# Altium schematic sheet AT-kdCONN.SchDoc
size A4; SheetNumber: 3; SheetTotal: 3
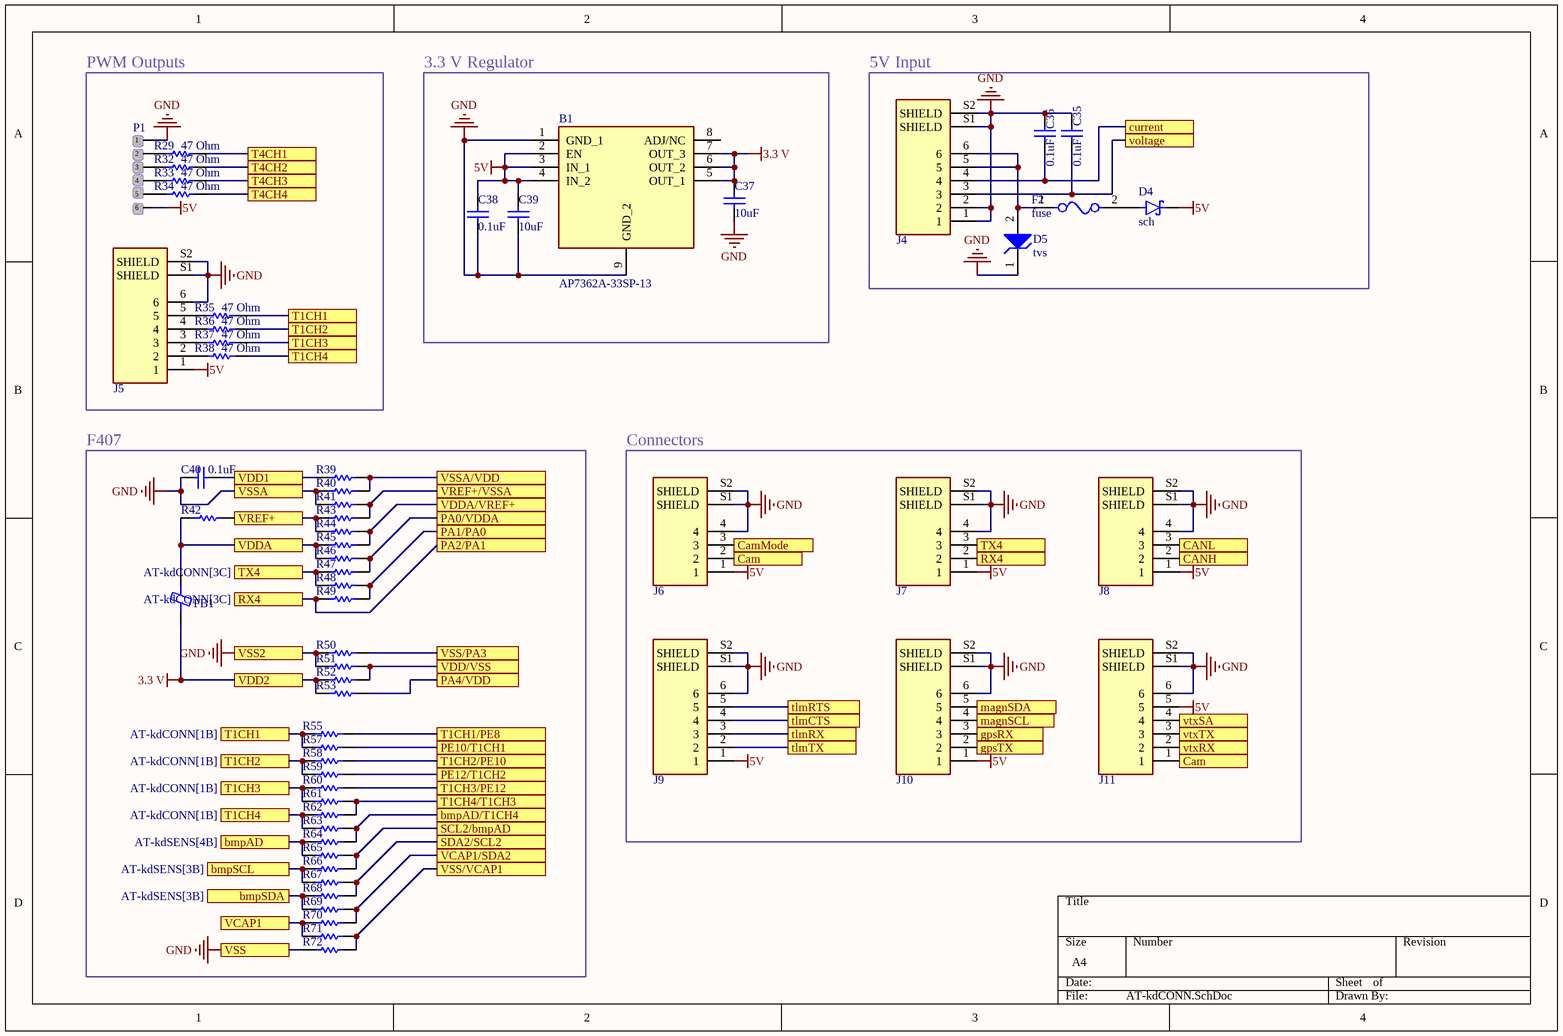
[diagram p0: AT-kdCONN.SchDoc]

## Parts
B1  AP7362A-33SP-13  [SOIC127P600X150-9N]
C35  0.1uF  [Capacitor-0603]
C36  0.1uF  [Capacitor-0603]
C37  10uF  [Capacitor-0603]
C38  0.1uF  [Capacitor-0603]
C39  10uF  [Capacitor-0603]
C40  0.1uF  [Capacitor-0603]
D4  sch  [SODFL3619X98N]
D5  tvs  [ONSC-SOD-123FL-2-498_V]
F2  fuse  [FP-MF-NSMF012-2-MFG]
FB1  100 Ohms @ 100 MHz  [BEADC1608X75N]  (value not drawn)
J4  BM06B-GHS-TBT(LF)(SN)(N)  [JST_BM06B-GHS-TBT(LF)(SN)(N)]  (value not drawn)
J5  BM06B-GHS-TBT(LF)(SN)(N)  [JST_BM06B-GHS-TBT(LF)(SN)(N)]  (value not drawn)
J6  BM04B-GHS-TBT(LF)(SN)(N)  [JST_BM04B-GHS-TBT(LF)(SN)(N)]  (value not drawn)
J7  BM04B-GHS-TBT(LF)(SN)(N)  [JST_BM04B-GHS-TBT(LF)(SN)(N)]  (value not drawn)
J8  BM04B-GHS-TBT(LF)(SN)(N)  [JST_BM04B-GHS-TBT(LF)(SN)(N)]  (value not drawn)
J9  BM06B-GHS-TBT(LF)(SN)(N)  [JST_BM06B-GHS-TBT(LF)(SN)(N)]  (value not drawn)
J10  BM06B-GHS-TBT(LF)(SN)(N)  [JST_BM06B-GHS-TBT(LF)(SN)(N)]  (value not drawn)
J11  BM06B-GHS-TBT(LF)(SN)(N)  [JST_BM06B-GHS-TBT(LF)(SN)(N)]  (value not drawn)
P1  Pad-6Pos  [Pad-6 Pos]  (value not drawn)
R29  47 Ohm  [Resistor-0603]
R32  47 Ohm  [Resistor-0603]
R33  47 Ohm  [Resistor-0603]
R34  47 Ohm  [Resistor-0603]
R35  47 Ohm  [Resistor-0603]
R36  47 Ohm  [Resistor-0603]
R37  47 Ohm  [Resistor-0603]
R38  47 Ohm  [Resistor-0603]
R39  CRCW02010000Z0ED  [RESC0603X28X15NL5T05]  (value not drawn)
R40  CRCW02010000Z0ED  [RESC0603X28X15NL5T05]  (value not drawn)
R41  CRCW02010000Z0ED  [RESC0603X28X15NL5T05]  (value not drawn)
R42  CRCW02010000Z0ED  [RESC0603X28X15NL5T05]  (value not drawn)
R43  CRCW02010000Z0ED  [RESC0603X28X15NL5T05]  (value not drawn)
R44  CRCW02010000Z0ED  [RESC0603X28X15NL5T05]  (value not drawn)
R45  CRCW02010000Z0ED  [RESC0603X28X15NL5T05]  (value not drawn)
R46  CRCW02010000Z0ED  [RESC0603X28X15NL5T05]  (value not drawn)
R47  CRCW02010000Z0ED  [RESC0603X28X15NL5T05]  (value not drawn)
R48  CRCW02010000Z0ED  [RESC0603X28X15NL5T05]  (value not drawn)
R49  CRCW02010000Z0ED  [RESC0603X28X15NL5T05]  (value not drawn)
R50  CRCW02010000Z0ED  [RESC0603X28X15NL5T05]  (value not drawn)
R51  CRCW02010000Z0ED  [RESC0603X28X15NL5T05]  (value not drawn)
R52  CRCW02010000Z0ED  [RESC0603X28X15NL5T05]  (value not drawn)
R53  CRCW02010000Z0ED  [RESC0603X28X15NL5T05]  (value not drawn)
R55  CRCW02010000Z0ED  [RESC0603X28X15NL5T05]  (value not drawn)
R57  CRCW02010000Z0ED  [RESC0603X28X15NL5T05]  (value not drawn)
R58  CRCW02010000Z0ED  [RESC0603X28X15NL5T05]  (value not drawn)
R59  CRCW02010000Z0ED  [RESC0603X28X15NL5T05]  (value not drawn)
R60  CRCW02010000Z0ED  [RESC0603X28X15NL5T05]  (value not drawn)
R61  CRCW02010000Z0ED  [RESC0603X28X15NL5T05]  (value not drawn)
R62  CRCW02010000Z0ED  [RESC0603X28X15NL5T05]  (value not drawn)
R63  CRCW02010000Z0ED  [RESC0603X28X15NL5T05]  (value not drawn)
R64  CRCW02010000Z0ED  [RESC0603X28X15NL5T05]  (value not drawn)
R65  CRCW02010000Z0ED  [RESC0603X28X15NL5T05]  (value not drawn)
R66  CRCW02010000Z0ED  [RESC0603X28X15NL5T05]  (value not drawn)
R67  CRCW02010000Z0ED  [RESC0603X28X15NL5T05]  (value not drawn)
R68  CRCW02010000Z0ED  [RESC0603X28X15NL5T05]  (value not drawn)
R69  CRCW02010000Z0ED  [RESC0603X28X15NL5T05]  (value not drawn)
R70  CRCW02010000Z0ED  [RESC0603X28X15NL5T05]  (value not drawn)
R71  CRCW02010000Z0ED  [RESC0603X28X15NL5T05]  (value not drawn)
R72  CRCW02010000Z0ED  [RESC0603X28X15NL5T05]  (value not drawn)

## Blocks framed on the sheet
PWM Outputs: J5 P1 R29 R32-R38
3.3 V Regulator: B1 C37-C39
5V Input: C35 C36 D4 D5 F2 J4
F407: C40 FB1 R39-R53 R55 R57-R72
Connectors: J6-J11

## Ports
bmpAD (see AT-kdSENS[4B]), bmpAD/T1CH4 (see AT-kdFCU[4C]), bmpSCL (see AT-kdSENS[3B]), bmpSDA (see AT-kdSENS[3B]), Cam (see AT-kdCONN[2C]), Cam (see AT-kdCONN[4C]), CamMode (see AT-kdFCU[3C]), CANH (see AT-kdSENS[2B]), CANL (see AT-kdSENS[2C]), current (see AT-kdFCU[3C]), gpsRX (see AT-kdFCU[3B]), gpsTX (see AT-kdFCU[3B]), magnSCL (see AT-kdSENS[2C]), magnSDA (see AT-kdSENS[2C]), PA0/VDDA (see AT-kdFCU[3A]), PA1/PA0 (see AT-kdFCU[3A]), PA2/PA1 (see AT-kdFCU[3A]), PA4/VDD (see AT-kdFCU[3A]), PE10/T1CH1 (see AT-kdFCU[4C]), PE12/T1CH2 (see AT-kdFCU[4C]), RX4 (see AT-kdCONN[1C]), RX4 (see AT-kdCONN[3C]), SCL2/bmpAD (see AT-kdFCU[3B]), SDA2/SCL2 (see AT-kdFCU[3B]), T1CH1 (see AT-kdCONN[1B]), T1CH1 (see AT-kdCONN[1C]), T1CH1/PE8 (see AT-kdFCU[4C]), T1CH2 (see AT-kdCONN[1B]), T1CH2 (see AT-kdCONN[1C]), T1CH2/PE10 (see AT-kdFCU[4C]), T1CH3 (see AT-kdCONN[1B]), T1CH3 (see AT-kdCONN[1D]), T1CH3/PE12 (see AT-kdFCU[4C]), T1CH4 (see AT-kdCONN[1B]), T1CH4 (see AT-kdCONN[1D]), T1CH4/T1CH3 (see AT-kdFCU[4C]), T4CH1 (see AT-kdFCU[4B]), T4CH2 (see AT-kdFCU[4B]), T4CH3 (see AT-kdFCU[4B]), T4CH4 (see AT-kdFCU[4B]), tlmCTS (see AT-kdFCU[4A]), tlmRTS (see AT-kdFCU[4A]), tlmRX (see AT-kdFCU[4B]), tlmTX (see AT-kdFCU[4A]), TX4 (see AT-kdCONN[1C]), TX4 (see AT-kdCONN[3C]), VCAP1 (see AT-kdFCU[2A]), VCAP1/SDA2 (see AT-kdFCU[1A]), VDD1, VDD2, VDD/VSS (see AT-kdFCU[1A]), VDDA (see AT-kdFCU[2A]), VDDA/VREF+ (see AT-kdFCU[1A]), voltage (see AT-kdFCU[3C]), VREF+ (see AT-kdFCU[3A]), VREF+/VSSA (see AT-kdFCU[1B]), VSS, VSS2, VSS/PA3 (see AT-kdFCU[2A]), VSS/VCAP1 (see AT-kdFCU[2A]), VSSA, VSSA/VDD (see AT-kdFCU[2B]), vtxRX (see AT-kdFCU[4B]), vtxSA (see AT-kdFCU[3C]), vtxTX (see AT-kdFCU[4B])

## Nets
3.3 V: B1.5(OUT_1) B1.6(OUT_2) B1.7(OUT_3) C37.1 FB1.1 R52.1 R53.1 ; port VDD2
5V: B1.2(EN) B1.3(IN_1) B1.4(IN_2) C38.1 C39.1 D4.K J5.1 J6.1 J7.1 J8.1 J9.1 J10.1 J11.5 P1.6
GND: B1.1(GND_1) B1.9(GND_2) C35.2 C36.2 C37.2 C38.2 C39.2 C40.1 D5.1(K) J4.1 J4.2 J4.S1(SHIELD) J4.S2(SHIELD) J5.6 J5.S1(SHIELD) J5.S2(SHIELD) J6.4 J6.S1(SHIELD) J6.S2(SHIELD) J7.4 J7.S1(SHIELD) J7.S2(SHIELD) J8.4 J8.S1(SHIELD) J8.S2(SHIELD) J9.6 J9.S1(SHIELD) J9.S2(SHIELD) J10.6 J10.S1(SHIELD) J10.S2(SHIELD) J11.6 J11.S1(SHIELD) J11.S2(SHIELD) P1.1 R40.1 R41.1 R50.1 R51.1 R72.1 ; port VSSA, port VSS2, port VSS
bmpAD: R64.1 R65.1 ; port bmpAD
bmpAD/T1CH4: R63.2 R64.2 ; port bmpAD/T1CH4
bmpSCL: R66.1 R67.1 ; port bmpSCL
bmpSDA: R68.1 R69.1 ; port bmpSDA
Cam: J6.2 J11.1 ; port Cam
CamMode: J6.3 ; port CamMode
CANH: J8.2 ; port CANH
CANL: J8.3 ; port CANL
current: C36.1 J4.4 ; port current
gpsRX: J10.3 ; port gpsRX
gpsTX: J10.2 ; port gpsTX
magnSCL: J10.4 ; port magnSCL
magnSDA: J10.5 ; port magnSDA
PA0/VDDA: R46.2 R47.2 ; port PA0/VDDA
PA1/PA0: R48.2 R49.2 ; port PA1/PA0
PA2/PA1: J7.2 R49.1 ; port PA2/PA1, port RX4
PA4/VDD: R53.2 ; port PA4/VDD
PE10/T1CH1: R57.2 ; port PE10/T1CH1
PE12/T1CH2: R59.2 ; port PE12/T1CH2
SCL2/bmpAD: R65.2 R66.2 ; port SCL2/bmpAD
SDA2/SCL2: R67.2 R68.2 ; port SDA2/SCL2
T1CH1: R35.2 R55.1 R57.1 ; port T1CH1
T1CH1/PE8: R55.2 ; port T1CH1/PE8
T1CH2: R36.2 R58.1 R59.1 ; port T1CH2
T1CH2/PE10: R58.2 ; port T1CH2/PE10
T1CH3: R37.2 R60.1 R61.1 ; port T1CH3
T1CH3/PE12: R60.2 ; port T1CH3/PE12
T1CH4: R38.2 R62.1 R63.1 ; port T1CH4
T1CH4/T1CH3: R61.2 R62.2 ; port T1CH4/T1CH3
T4CH1: R29.2 ; port T4CH1
T4CH2: R32.2 ; port T4CH2
T4CH3: R33.2 ; port T4CH3
T4CH4: R34.2 ; port T4CH4
tlmCTS: J9.4 ; port tlmCTS
tlmRTS: J9.5 ; port tlmRTS
tlmRX: J9.3 ; port tlmRX
tlmTX: J9.2 ; port tlmTX
TX4: J7.3 R47.1 R48.1 ; port TX4
VCAP1: R70.1 R71.1 ; port VCAP1
VCAP1/SDA2: R69.2 R70.2 ; port VCAP1/SDA2
VDD1: C40.2 R39.1 ; port VDD1
VDD/VSS: R51.2 R52.2 ; port VDD/VSS
VDDA: FB1.2 R42.1 R45.1 R46.1 ; port VDDA
VDDA/VREF+: R44.2 R45.2 ; port VDDA/VREF+
voltage: C35.1 J4.3 ; port voltage
VREF+: R42.2 R43.1 R44.1 ; port VREF+
VREF+/VSSA: R41.2 R43.2 ; port VREF+/VSSA
VSS/PA3: R50.2 ; port VSS/PA3
VSS/VCAP1: R71.2 R72.2 ; port VSS/VCAP1
VSSA/VDD: R39.2 R40.2 ; port VSSA/VDD
vtxRX: J11.2 ; port vtxRX
vtxSA: J11.4 ; port vtxSA
vtxTX: J11.3 ; port vtxTX
NetD4_A: D4.A F2.2
NetD5_2: D5.2(A) F2.1 J4.5 J4.6
NetJ5_2: J5.2 R38.1
NetJ5_3: J5.3 R37.1
NetJ5_4: J5.4 R36.1
NetJ5_5: J5.5 R35.1
NetP1_2: P1.2 R29.1
NetP1_3: P1.3 R32.1
NetP1_4: P1.4 R33.1
NetP1_5: P1.5 R34.1

Not connected (* = marked no-connect by the designer): B1 8(ADJ/NC)

## Library data of the parts
B1 = AP7362A-33SP-13: LDO Voltage Regulators LDO CMOS HiCurr SO-8 1.5A LowQ Adj 190mV; Manufacturer_Name: Diodes Incorporated; Geometry.Height: 1.5mm; Manufacturer_Part_Number: AP7362A-33SP-13; Mouser Part Number: 621-AP7362A-33SP-13; Mouser Price/Stock: https://www.mouser.co.uk/ProductDetail/Diodes-Incorporated/AP7362A-33SP-13?qs=M%2FOdCRO8QQ3CiX1oDLy5Bg%3D%3D; Arrow Part Number: AP7362A-33SP-13; Arrow Price/Stock: https://www.arrow.com/en/products/ap7362a-33sp-13/diodes-incorporated?utm_currency=USD&region=nac; Datasheet Link: https://www.diodes.com/assets/Datasheets/AP7362.pdf
C35-C40 = 0603-Cap
D4 = MBR230LSFT1G: DIODE SCHOTTKY 30V 2A SOD123 MBR230LSTR; MF: ON Semiconductor; SnapEDA_Link: https://www.snapeda.com/parts/MBR230LSFT1G/Onsemi/view-part/?ref=snap; Package: SOD-123FL-2 ON Semiconductor; Value: *; MP: MBR230LSFT1G; Check_prices: https://www.snapeda.com/parts/MBR230LSFT1G/Onsemi/view-part/?ref=eda
D5 = CMP-1061-00612-1: 200 W Transient Voltage Suppressor, 2-Pin SOD-123FL, Pb-Free, Tape and Reel; PartNumber: SMF5.0AT1G; Manufacturer: On Semiconductor; Direction: Unidirectional; IR Max (uA): 400; V(BR) Typ (V): 6.7; PackageDescription: 2-Pin SOD, Body 1.65 x 2.7 mm; ComponentLink3Description: Package Specification; ComponentLink3URL: http://www.onsemi.com/pub_link/Collateral/498-01.PDF; PackageVersion: Rev. D, 05/2013; Mounting Technology: Surface Mount; PackageReference: SOD-123FL-2-498; ComponentLink2URL: http://www.onsemi.com/pub_link/Collateral/SMF5.0AT1-D.PDF; DatasheetVersion: Rev. 7; ComponentLink1Description: Manufacturer URL; Packing: Tape and Reel; RoHS: Pb-Free; ComponentLink1URL: http://www.onsemi.com/; ComponentLink2Description: Datasheet
F2 = CMP-07400-000025-1: PTC RESET FUSE 30V 120MA 1206; Manufacturer Part Number: MF-NSMF012-2; Manufacturer: Bourns Inc.; Hold Current: 0.12A; Trip Time: 0.2s; Trip Current: 0.29A; Automotive Grade: Grade 3; Resistance: 1.35-8.5Ω; Current Rating: 10A; Value: 1.35-8.5Ω; Category: Fuse; Device Class L2: PTC Resettable Fuses; ComponentLink2URL: https://www.bourns.com/docs/Product-Datasheets/mfnsmf.pdf; Package: MF-NSMF012-2; Automotive: Yes; Temperature Range Low: -40°C; Lead Free: Yes; Voltage Rating: 30V; Digikey Description: PTC RESET FUSE 30V 120MA 1206; Ambient Temperature Range Low: -40°C; Ambient Temperature Range High: +85°C; RoHS: TRUE; Device Class L3: unset; Device Class L1: Circuit Protection; Mouser Description: Resettable Fuses - PPTC 0.12A 30V 1.35ohm; Octopart: https://octopart.com/mf-nsmf012-2-bourns-24569; Temperature Range High: +85°C; ComponentLink2Description: Datasheet; Height: 1.1mm; Temperature: -40°C to +85°C
FB1 = MPZ1608D101BTA00: Ferrite Beads Multi-Layer High Current 600Ohm 25% 100MHz 2.3A 0.06Ohm DCR 0805 Automotive T/R; Manufacturer: TDK Corporation; Manufacturer Part Number: BLM21SP601SH1D; Current Rating (Max): 1A; DC Resistance (DCR) (Max): 150mOhm; Filter Type: Power Line; Number of Lines: 1; Current Rating: 1.5A; DC Resistance (DCR): 60mΩ; Impedance: 600Ω; Part Number: MPZ1608D101BTA00; ComponentLink1Description: Datasheet; ComponentLink1URL: https://product.tdk.com/info/en/catalog/datasheets/beads_commercial_power_mpz1608_en.pdf?ref_disty=digikey; ComponentLink2Description: DigiKey Link; ComponentLink2URL: https://www.digikey.com/en/products/detail/tdk-corporation/MPZ1608D101BTA00/1084520; Device Package: 0603 (1608 Metric); Height (Max): 0.037" (0.95mm); Impedance @ Frequency: 100 Ohms @ 100 MHz; LastUpdated: 3/06/2024 19:51:52; Lifecycle Status: Active; Minimum Order: 1; Mounting Type: Surface Mount; Operating Temperature: -55°C ~ 125°C; Package / Case: 0603 (1608 Metric); Packaging: TapeAndReel; PartId: 843; Part Status: Active; Price: 0.02; Series: MPZ; Size / Dimension: 0.063" L x 0.032" W (1.60mm x 0.80mm); Supplier 1: DigiKey; Supplier Part Number 1: 445-MPZ1608D101BTA00CT-ND; Value: 100 Ohms @ 100 MHz; Supplier: Farnell; Supplier Part Number: 3227839; RoHS: Compliant; Category: Ferrite Beads and Chips; Stock: 12289; Pricing: 10=0,218, 100=0,151, 500=0,108, 1000=0,0961, 2000=0,0879, 4000=0,0797 (EUR); Case/Package: 0805; Core Material: Ferrite; Height: 850µm; Length: 2mm; Max Operating Temperature: 125°C; Min Operating Temperature: -55°C; Number of Circuits: 1; Number of Terminals: 2; REACH SVHC: Yes; RMS Current (Irms): 2.3A; Schedule B: 8504500000, 8543706000, 8543706000|8543706000, 8543706000|8543706000|8543706000; ESR: 60mΩ; Test Frequency: 100MHz; Tolerance: 25%; Width: 1.25mm; ComponentLink3URL: https://datasheet.octopart.com:443/BLM21SP601SH1D-Murata-datasheet-180807142.pdf?src-supplier=IHS; ComponentLink3Description: https://datasheet.octopart.com:443/BLM21SP601SH1D-Murata-datasheet-180807142.pdf?src-supplier=IHS; ComponentLink4URL: https://datasheet.octopart.com:443/BLM21SP601SH1D-Murata-datasheet-138707483.pdf?src-supplier=ODG+(Origin+Data+Global); ComponentLink4Description: https://datasheet.octopart.com:443/BLM21SP601SH1D-Murata-datasheet-138707483.pdf?src-supplier=ODG+(Origin+Data+Global); ComponentLink5URL: https://datasheet.octopart.com:443/BLM21SP601SH1D-Murata-datasheet-166171483.pdf?src-supplier=TME; ComponentLink5Description: https://datasheet.octopart.com:443/BLM21SP601SH1D-Murata-datasheet-166171483.pdf?src-supplier=TME; ComponentLink6URL: http://sigma.octopart.com:80/reach_statement/Murata-company-16.pdf?src-supplier=Compliance+Statements; ComponentLink6Description: http://sigma.octopart.com:80/reach_statement/Murata-company-16.pdf?src-supplier=Compliance+Statements
J4 J5 J9-J11 = BM06B-GHS-TBT(LF)(SN)(N): Connector Header Surface Mount 6 position 0.049 (1.25mm); MF: JST Sales; SnapEDA_Link: https://www.snapeda.com/parts/BM06B-GHS-TBT(LF)(SN)(N)/JST/view-part/?ref=snap; Package: None; Value: *; MP: BM06B-GHS-TBT(LF)(SN)(N); Check_prices: https://www.snapeda.com/parts/BM06B-GHS-TBT(LF)(SN)(N)/JST/view-part/?ref=eda
J6-J8 = BM04B-GHS-TBT(LF)(SN)(N): Conn Shrouded Header HDR 4 POS 1.25mm Solder ST Top Entry SMD T/R; MF: JST; SnapEDA_Link: https://www.snapeda.com/parts/BM04B-GHS-TBT%20(LF)(SN)(N)/JST/view-part/?ref=snap; Package: None; Value: *; MP: BM04B-GHS-TBT (LF)(SN)(N); Check_prices: https://www.snapeda.com/parts/BM04B-GHS-TBT%20(LF)(SN)(N)/JST/view-part/?ref=eda
R29 R32-R38 = 0603-Res
R39-R53 R55 R57-R72 = CMP-2004-00001-2: Chip Resistor, 0 Ohm, Jumper, 0.05 W, -55 to 155 degC, 0201 (0603 Metric), RoHS, Tape and Reel; Voltage Rating: 30 V; Case\Package: 0201; Resistance: 0 mohm; Tolerance: 5%; Power Rating: 50 mW; REACH SVHC: Unknown; Length: 0.6 mm; Packaging: Cut Tape; Weight: 6E-06 oz; ComponentLink2URL: http://www.vishay.com/docs/20052/crcw0201e3.pdf; Mounting Technology: Surface Mount; Case Code (Imperial): 0201; Radiation Hardening: No; RoHSCompliant: true; Package Quantity: 1; Min Operating Temperature: -55 degC; Height: 0.23 mm; PackageReference: 0201; ComponentLink1Description: Manufacturer URL; ComponentLink2Description: Datasheet; Case Code (Metric): 0603; DatasheetVersion: 03/2016; Width: 0.3 mm; Mount: Surface Mount; PackageDescription: 2-Pin Surface Mount Device, Body 0.6 x 0.3 mm; ComponentLink1URL: http://www.vishay.com/; Max Operating Temperature: 155 degC